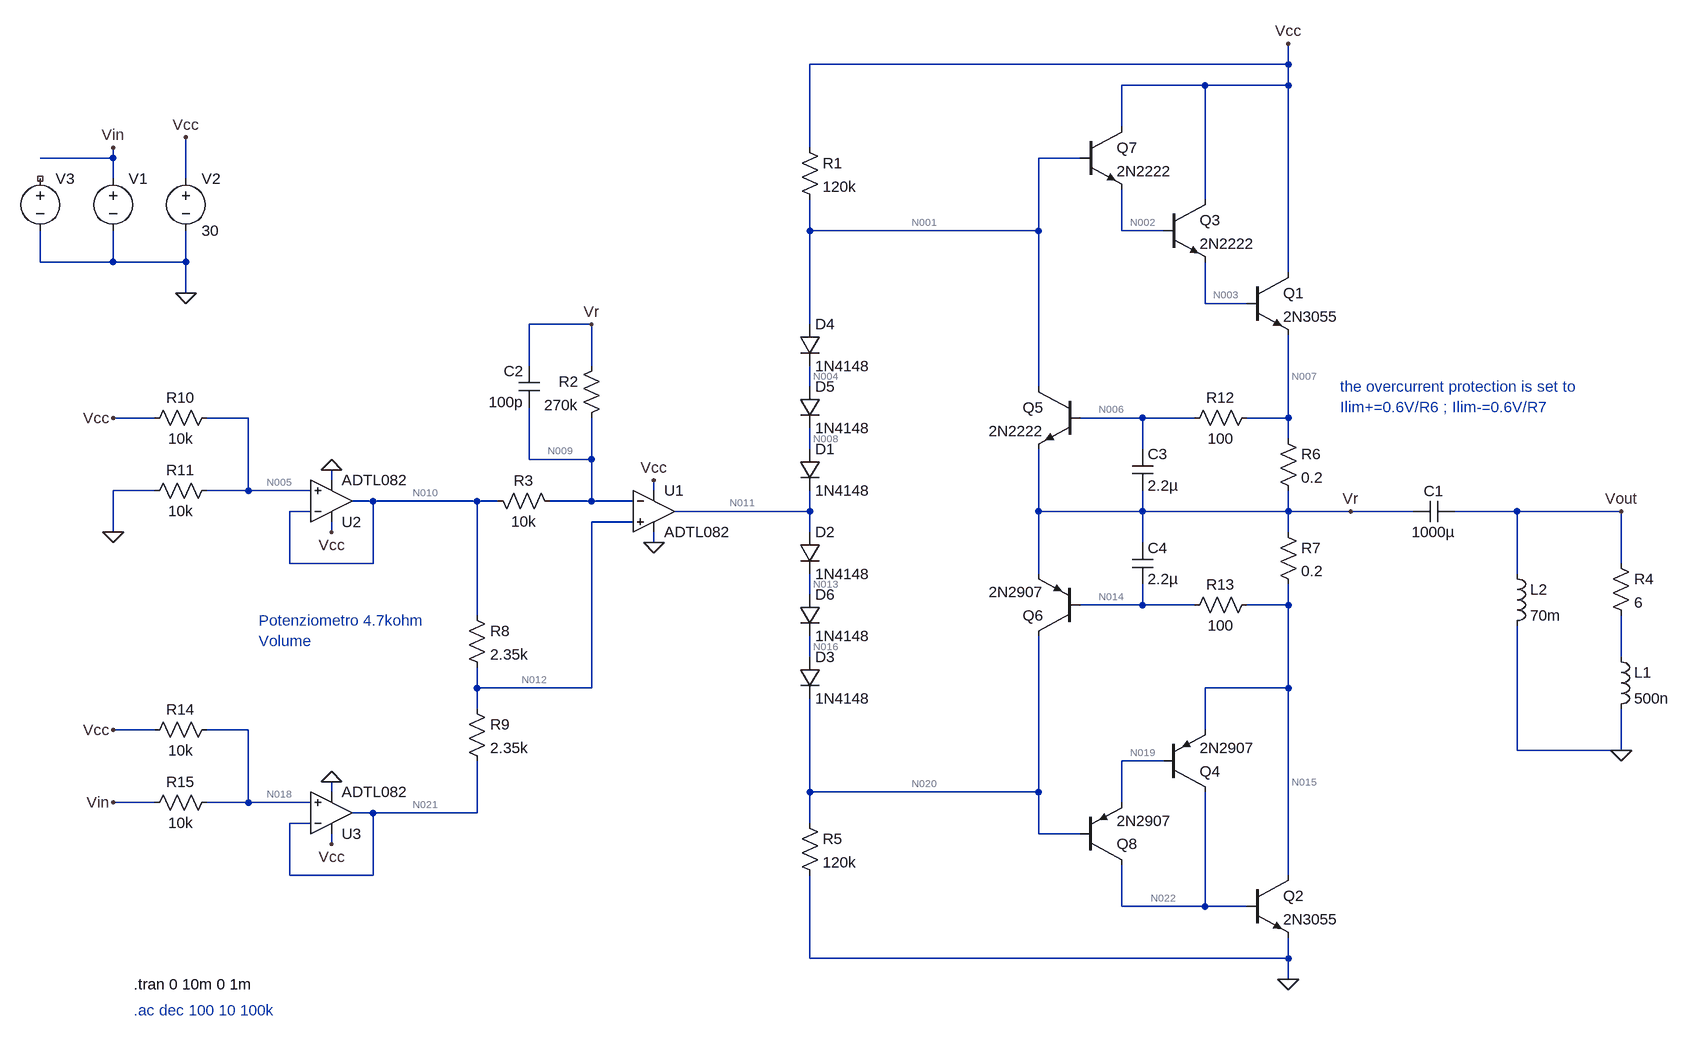
[diagram p0: schematic AB amplifier v2.asc]
AB amplifier v2.asc, the LTspice schematic file:
Version 4.1
SHEET 1 1812 848
WIRE 784 -624 784 -656
WIRE 784 -624 48 -624
WIRE 656 -592 528 -592
WIRE 784 -592 784 -624
WIRE 784 -592 656 -592
WIRE 528 -528 528 -592
WIRE 48 -496 48 -624
WIRE -1024 -480 -1024 -496
WIRE -1024 -480 -1136 -480
WIRE 464 -480 400 -480
WIRE -1024 -448 -1024 -480
WIRE -912 -448 -912 -512
WIRE 656 -416 656 -592
WIRE 48 -368 48 -416
WIRE 400 -368 400 -480
WIRE 400 -368 48 -368
WIRE 528 -368 528 -432
WIRE 592 -368 528 -368
WIRE -1136 -320 -1136 -368
WIRE -1024 -320 -1024 -368
WIRE -1024 -320 -1136 -320
WIRE -912 -320 -912 -368
WIRE -912 -320 -1024 -320
WIRE 784 -304 784 -592
WIRE -912 -272 -912 -320
WIRE 656 -256 656 -320
WIRE 720 -256 656 -256
WIRE -288 -224 -384 -224
WIRE 48 -224 48 -368
WIRE -384 -160 -384 -224
WIRE -288 -160 -288 -224
WIRE 48 -128 48 -160
WIRE 400 -128 400 -368
WIRE -960 -80 -1024 -80
WIRE -816 -80 -880 -80
WIRE 560 -80 464 -80
WIRE 640 -80 560 -80
WIRE 784 -80 784 -208
WIRE 784 -80 720 -80
WIRE 784 -48 784 -80
WIRE 48 -32 48 -64
WIRE 560 -32 560 -80
WIRE -384 -16 -384 -96
WIRE -288 -16 -288 -80
WIRE -288 -16 -384 -16
WIRE -688 16 -688 0
WIRE -960 32 -1024 32
WIRE -816 32 -816 -80
WIRE -816 32 -880 32
WIRE -720 32 -816 32
WIRE -192 32 -192 16
WIRE -624 48 -656 48
WIRE -464 48 -624 48
WIRE -432 48 -464 48
WIRE -288 48 -288 -16
WIRE -288 48 -352 48
WIRE -224 48 -288 48
WIRE -720 64 -752 64
WIRE 48 64 48 32
WIRE 48 64 -160 64
WIRE 400 64 400 -32
WIRE 560 64 560 32
WIRE 560 64 400 64
WIRE 784 64 784 32
WIRE 784 64 560 64
WIRE 880 64 784 64
WIRE 976 64 880 64
WIRE 1136 64 1040 64
WIRE 1296 64 1136 64
WIRE -224 80 -288 80
WIRE -1024 96 -1024 32
WIRE -688 96 -688 80
WIRE 48 96 48 64
WIRE 784 96 784 64
WIRE -192 112 -192 96
WIRE 560 112 560 64
WIRE -752 144 -752 64
WIRE -624 144 -624 48
WIRE -624 144 -752 144
WIRE 1296 144 1296 64
WIRE 400 160 400 64
WIRE 1136 160 1136 64
WIRE 48 192 48 160
WIRE 560 208 560 176
WIRE 560 208 464 208
WIRE 640 208 560 208
WIRE 784 208 784 176
WIRE 784 208 720 208
WIRE -464 224 -464 48
WIRE 48 288 48 256
WIRE 1296 288 1296 224
WIRE -464 336 -464 304
WIRE -288 336 -288 80
WIRE -288 336 -464 336
WIRE 784 336 784 208
WIRE 784 336 656 336
WIRE -464 368 -464 336
WIRE -960 400 -1024 400
WIRE -816 400 -880 400
WIRE 656 400 656 336
WIRE 1136 432 1136 240
WIRE 1296 432 1296 368
WIRE 1296 432 1136 432
WIRE 592 448 528 448
WIRE -688 496 -688 480
WIRE 48 496 48 352
WIRE 400 496 400 256
WIRE 400 496 48 496
WIRE -960 512 -1024 512
WIRE -816 512 -816 400
WIRE -816 512 -880 512
WIRE -720 512 -816 512
WIRE 528 512 528 448
WIRE -624 528 -656 528
WIRE -464 528 -464 448
WIRE -464 528 -624 528
WIRE -720 544 -752 544
WIRE 48 544 48 496
WIRE 400 560 400 496
WIRE 464 560 400 560
WIRE -688 576 -688 560
WIRE -752 624 -752 544
WIRE -624 624 -624 528
WIRE -624 624 -752 624
WIRE 784 624 784 336
WIRE 528 672 528 608
WIRE 656 672 656 496
WIRE 656 672 528 672
WIRE 720 672 656 672
WIRE 48 752 48 624
WIRE 784 752 784 720
WIRE 784 752 48 752
WIRE 784 784 784 752
FLAG -192 16 Vcc
FLAG -288 -224 Vr
FLAG -912 -512 Vcc
FLAG 1296 64 Vout
FLAG -192 112 0
FLAG 1296 432 0
FLAG -912 -272 0
FLAG -1024 96 0
FLAG -1024 -80 Vcc
FLAG -1024 -496 Vin
FLAG 880 64 Vr
FLAG 784 784 0
FLAG 784 -656 Vcc
FLAG -688 96 Vcc
FLAG -688 0 0
FLAG -1024 400 Vcc
FLAG -688 576 Vcc
FLAG -688 480 0
FLAG -1024 512 Vin
SYMBOL npn 720 -304 R0
SYMATTR InstName Q1
SYMATTR Value 2N3055
SYMBOL npn 592 -416 R0
SYMATTR InstName Q3
SYMATTR Value 2N2222
SYMBOL pnp 592 496 M180
SYMATTR InstName Q4
SYMATTR Value 2N2907
SYMBOL res 32 -512 R0
SYMATTR InstName R1
SYMATTR Value 120k
SYMBOL diode 32 -32 R0
SYMATTR InstName D1
SYMATTR Value 1N4148
SYMBOL diode 32 96 R0
SYMATTR InstName D2
SYMATTR Value 1N4148
SYMBOL diode 32 288 R0
SYMATTR InstName D3
SYMATTR Value 1N4148
SYMBOL OpAmps\\ADTL082 -192 0 R0
SYMATTR InstName U1
SYMBOL res -272 -176 M0
SYMATTR InstName R2
SYMATTR Value 270k
SYMBOL res -448 32 M90
WINDOW 0 0 56 VBottom 2
WINDOW 3 32 56 VTop 2
SYMATTR InstName R3
SYMATTR Value 10k
SYMBOL res 1280 128 R0
SYMATTR InstName R4
SYMATTR Value 6
SYMBOL ind 1280 272 R0
SYMATTR InstName L1
SYMATTR Value 500n
SYMBOL voltage -1024 -464 R0
WINDOW 3 24 96 Invisible 2
WINDOW 39 0 0 Left 0
SYMATTR Value SINE(0 0.7 1k)
SYMATTR InstName V1
SYMATTR Value2 AC 1 0
SYMBOL voltage -912 -464 R0
WINDOW 123 0 0 Left 0
WINDOW 39 0 0 Left 0
SYMATTR InstName V2
SYMATTR Value 30
SYMBOL res 32 528 R0
SYMATTR InstName R5
SYMATTR Value 120k
SYMBOL diode 32 -224 R0
SYMATTR InstName D4
SYMATTR Value 1N4148
SYMBOL cap 1040 48 R90
WINDOW 0 0 32 VBottom 2
WINDOW 3 32 32 VTop 2
SYMATTR InstName C1
SYMATTR Value 1000µ
SYMBOL res -864 -96 R90
WINDOW 0 0 56 VBottom 2
WINDOW 3 32 56 VTop 2
SYMATTR InstName R10
SYMATTR Value 10k
SYMBOL res -864 16 R90
WINDOW 0 0 56 VBottom 2
WINDOW 3 32 56 VTop 2
SYMATTR InstName R11
SYMATTR Value 10k
SYMBOL cap -368 -160 M0
SYMATTR InstName C2
SYMATTR Value 100p
SYMBOL res 768 -64 R0
SYMATTR InstName R6
SYMATTR Value 0.2
SYMBOL res 768 80 R0
SYMATTR InstName R7
SYMATTR Value 0.2
SYMBOL npn 464 -128 M0
SYMATTR InstName Q5
SYMATTR Value 2N2222
SYMBOL npn 720 624 R0
SYMATTR InstName Q2
SYMATTR Value 2N3055
SYMBOL res 736 -96 R90
WINDOW 0 0 56 VBottom 2
WINDOW 3 32 56 VTop 2
SYMATTR InstName R12
SYMATTR Value 100
SYMBOL cap 544 -32 R0
SYMATTR InstName C3
SYMATTR Value 2.2µ
SYMBOL pnp 464 256 R180
SYMATTR InstName Q6
SYMATTR Value 2N2907
SYMBOL res 736 192 R90
WINDOW 0 0 56 VBottom 2
WINDOW 3 32 56 VTop 2
SYMATTR InstName R13
SYMATTR Value 100
SYMBOL cap 544 112 R0
SYMATTR InstName C4
SYMATTR Value 2.2µ
SYMBOL voltage -1136 -464 R0
WINDOW 3 24 96 Invisible 2
WINDOW 39 0 0 Left 0
SYMATTR Value PWL(0 0 1m 0 10m 5)
SYMATTR InstName V3
SYMATTR Value2 AC 1 0
SYMBOL npn 464 -528 R0
SYMATTR InstName Q7
SYMATTR Value 2N2222
SYMBOL pnp 464 608 M180
SYMATTR InstName Q8
SYMATTR Value 2N2907
SYMBOL diode 32 -128 R0
SYMATTR InstName D5
SYMATTR Value 1N4148
SYMBOL diode 32 192 R0
SYMATTR InstName D6
SYMATTR Value 1N4148
SYMBOL ind 1120 144 R0
SYMATTR InstName L2
SYMATTR Value 70m
SYMBOL OpAmps\\ADTL082 -688 112 M180
SYMATTR InstName U2
SYMBOL res -864 384 R90
WINDOW 0 0 56 VBottom 2
WINDOW 3 32 56 VTop 2
SYMATTR InstName R14
SYMATTR Value 10k
SYMBOL res -864 496 R90
WINDOW 0 0 56 VBottom 2
WINDOW 3 32 56 VTop 2
SYMATTR InstName R15
SYMATTR Value 10k
SYMBOL OpAmps\\ADTL082 -688 592 M180
SYMATTR InstName U3
SYMBOL res -480 208 R0
SYMATTR InstName R8
SYMATTR Value 2.35k
SYMBOL res -480 352 R0
SYMATTR InstName R9
SYMATTR Value 2.35k
TEXT -992 792 Left 2 !.tran 0 10m 0 1m
TEXT -992 832 Left 2 ;.ac dec 100 10 100k
TEXT 864 -128 Left 2 ;the overcurrent protection is set to\nIlim+=0.6V/R6 ; Ilim-=0.6V/R7
TEXT -800 232 Left 2 ;Potenziometro 4.7kohm\nVolume

The netlist it stands for:
* AB amplifier v2.asc
Q1 Vcc N003 N007 0 2N3055
Q3 Vcc N002 N003 0 2N2222
Q4 N022 N019 N015 0 2N2907
R1 Vcc N001 120k
D1 N008 N011 1N4148
D2 N011 N013 1N4148
D3 N016 N020 1N4148
X§U1 N012 N009 Vcc 0 N011 ADTL082  ; pins In+ In- V+ V- OUT
R2 Vr N009 270k
R3 N010 N009 10k
R4 Vout N017 6
L1 N017 0 500n
V1 Vin 0 SINE(0 0.7 1k) AC 1 0
V2 Vcc 0 30
R5 N020 0 120k
D4 N001 N004 1N4148
C1 Vout Vr 1000µ
R10 N005 Vcc 10k
R11 N005 0 10k
C2 Vr N009 100p
R6 N007 Vr 0.2
R7 Vr N015 0.2
Q5 N001 N006 Vr 0 2N2222
Q2 N015 N022 0 0 2N3055
R12 N007 N006 100
C3 N006 Vr 2.2µ
Q6 N020 N014 Vr 0 2N2907
R13 N015 N014 100
C4 Vr N014 2.2µ
V3 NC_01 0 PWL(0 0 1m 0 10m 5) AC 1 0
Q7 Vcc N001 N002 0 2N2222
Q8 N022 N020 N019 0 2N2907
D5 N004 N008 1N4148
D6 N013 N016 1N4148
L2 Vout 0 70m
X§U2 N005 N010 Vcc 0 N010 ADTL082  ; pins In+ In- V+ V- OUT
R14 N018 Vcc 10k
R15 N018 Vin 10k
X§U3 N018 N021 Vcc 0 N021 ADTL082  ; pins In+ In- V+ V- OUT
R8 N010 N012 2.35k
R9 N012 N021 2.35k
.model D D
.lib standard.dio
.model NPN NPN
.model PNP PNP
.lib standard.bjt
.tran 0 10m 0 1m
* .ac dec 100 10 100k
* the overcurrent protection is set to
* Ilim+=0.6V/R6 ; Ilim-=0.6V/R7
* Potenziometro 4.7kohm
* Volume
.lib ADI.lib
.backanno
.end

* Results of the author's LTspice run, read from the files saved beside the schematic
* Operating Point, zero values left out:
*   V(n003) = 15.45 V
*   V(n002) = 16.13 V
*   V(n022) = 414.8 mV
*   V(n015) = 14.97 V
*   V(n011) = 15.21 V
*   V(n016) = 14.24 V
*   V(n020) = 13.75 V
*   V(n009) = 15 V
*   V(n006) = 15.04 V
*   V(n018) = 15 V
*   V(vcc) = 30 V
*   V(n007) = 15.04 V
*   V(n019) = 14.29 V
*   V(n001) = 16.67 V
*   V(n008) = 15.7 V
*   V(n013) = 14.73 V
*   V(n012) = 15 V
*   V(vr) = 15 V
*   V(n010) = 15 V
*   V(n004) = 16.18 V
*   V(n005) = 15 V
*   V(n014) = 14.97 V
*   V(n021) = 15 V
*   I(D4) = 111.1 µA
*   Ic(Q1) = 170.6 mA
*   Ib(Q1) = 2.736 mA
*   Ie(Q1) = -173.4 mA
*   I(V1) = 1.5 mA
*   I(R6) = 173.4 mA
*   Ic(Q2) = 170.6 mA
*   Ib(Q2) = 2.736 mA
*   Ie(Q2) = -173.4 mA
*   Ic(Q4) = -2.726 mA
*   Ib(Q4) = -9.855 µA
*   Ie(Q4) = 2.736 mA
*   I(D2) = 114.6 µA
*   I(D6) = 114.6 µA
*   I(R5) = 114.6 µA
*   Ic(Q7) = 12 µA
*   Ib(Q7) = 52.95 nA
*   Ie(Q7) = -12.06 µA
*   I(R3) = -1.988 nA
*   I(R10) = -1.5 mA
*   Ic(Q5) = 1.67 pA
*   Ib(Q5) = -1.599 pA
*   I(D1) = 111.1 µA
*   I(D3) = 114.6 µA
*   I(R12) = -1.599 pA
*   I(R15) = 1.5 mA
*   I(R13) = 1.18 pA
*   I(R8) = 1 pA
*   Ic(Q3) = 2.724 mA
*   Ib(Q3) = 12.06 µA
*   Ie(Q3) = -2.736 mA
*   I(D5) = 111.1 µA
*   I(R2) = 1.99 nA
*   I(R11) = 1.5 mA
*   I(R7) = 173.4 mA
*   Ic(Q8) = -9.82 µA
*   Ib(Q8) = -35.34 nA
*   Ie(Q8) = 9.855 µA
*   I(R14) = -1.5 mA
*   I(R1) = 111.1 µA
*   I(V2) = -191.9 mA
*   Ic(Q6) = -1.255 pA
*   Ib(Q6) = 1.18 pA
*   Ix(u2:1) = 2 pA
*   Ix(u2:2) = 2 pA
*   Ix(u2:3) = 5.124 mA
*   Ix(u2:4) = -5.124 mA
*   Ix(u2:5) = 1.985 nA
*   Ix(u1:1) = 2 pA
*   Ix(u1:2) = 2 pA
*   Ix(u1:3) = 5.126 mA
*   Ix(u1:4) = -5.122 mA
*   Ix(u1:5) = -3.519 µA
*   Ix(u3:1) = 2 pA
*   Ix(u3:2) = 2 pA
*   Ix(u3:3) = 5.124 mA
*   Ix(u3:4) = -5.124 mA
*   Ix(u3:5) = -3 pA
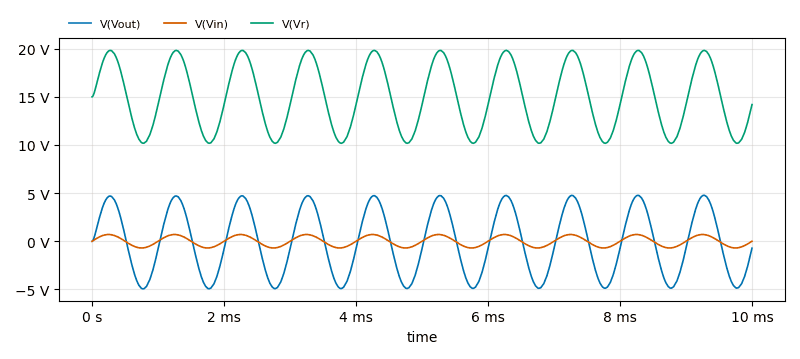
[diagram p1: Transient Analysis of AB amplifier v2.asc, plotted from the saved traces]
* Transient Analysis, 1 run:
*   V(Vout): min -4.941 V, max 4.776 V, average -76.8 mV, rms 3.417 V, last -721.7 mV
*   V(Vin): min -699.8 mV, max 700 mV, average 599.6 µV, rms 495.8 mV, last 0 V
*   V(Vr): min 10.17 V, max 19.83 V, average 15.01 V, rms 15.39 V, last 14.2 V